# EasyEDA Pro project glowing_match_logo_easyEDA.eprj

# Schematic Schematic1
Board Name: Board1; Create Date: 2026-04-20; Page Name: P1; Project Name: match_Coin_V2; Schematic Name: Schematic1; Update Date: 2026-04-20; Company: EasyEDA.com; Page Size: A4; Version: V1.0
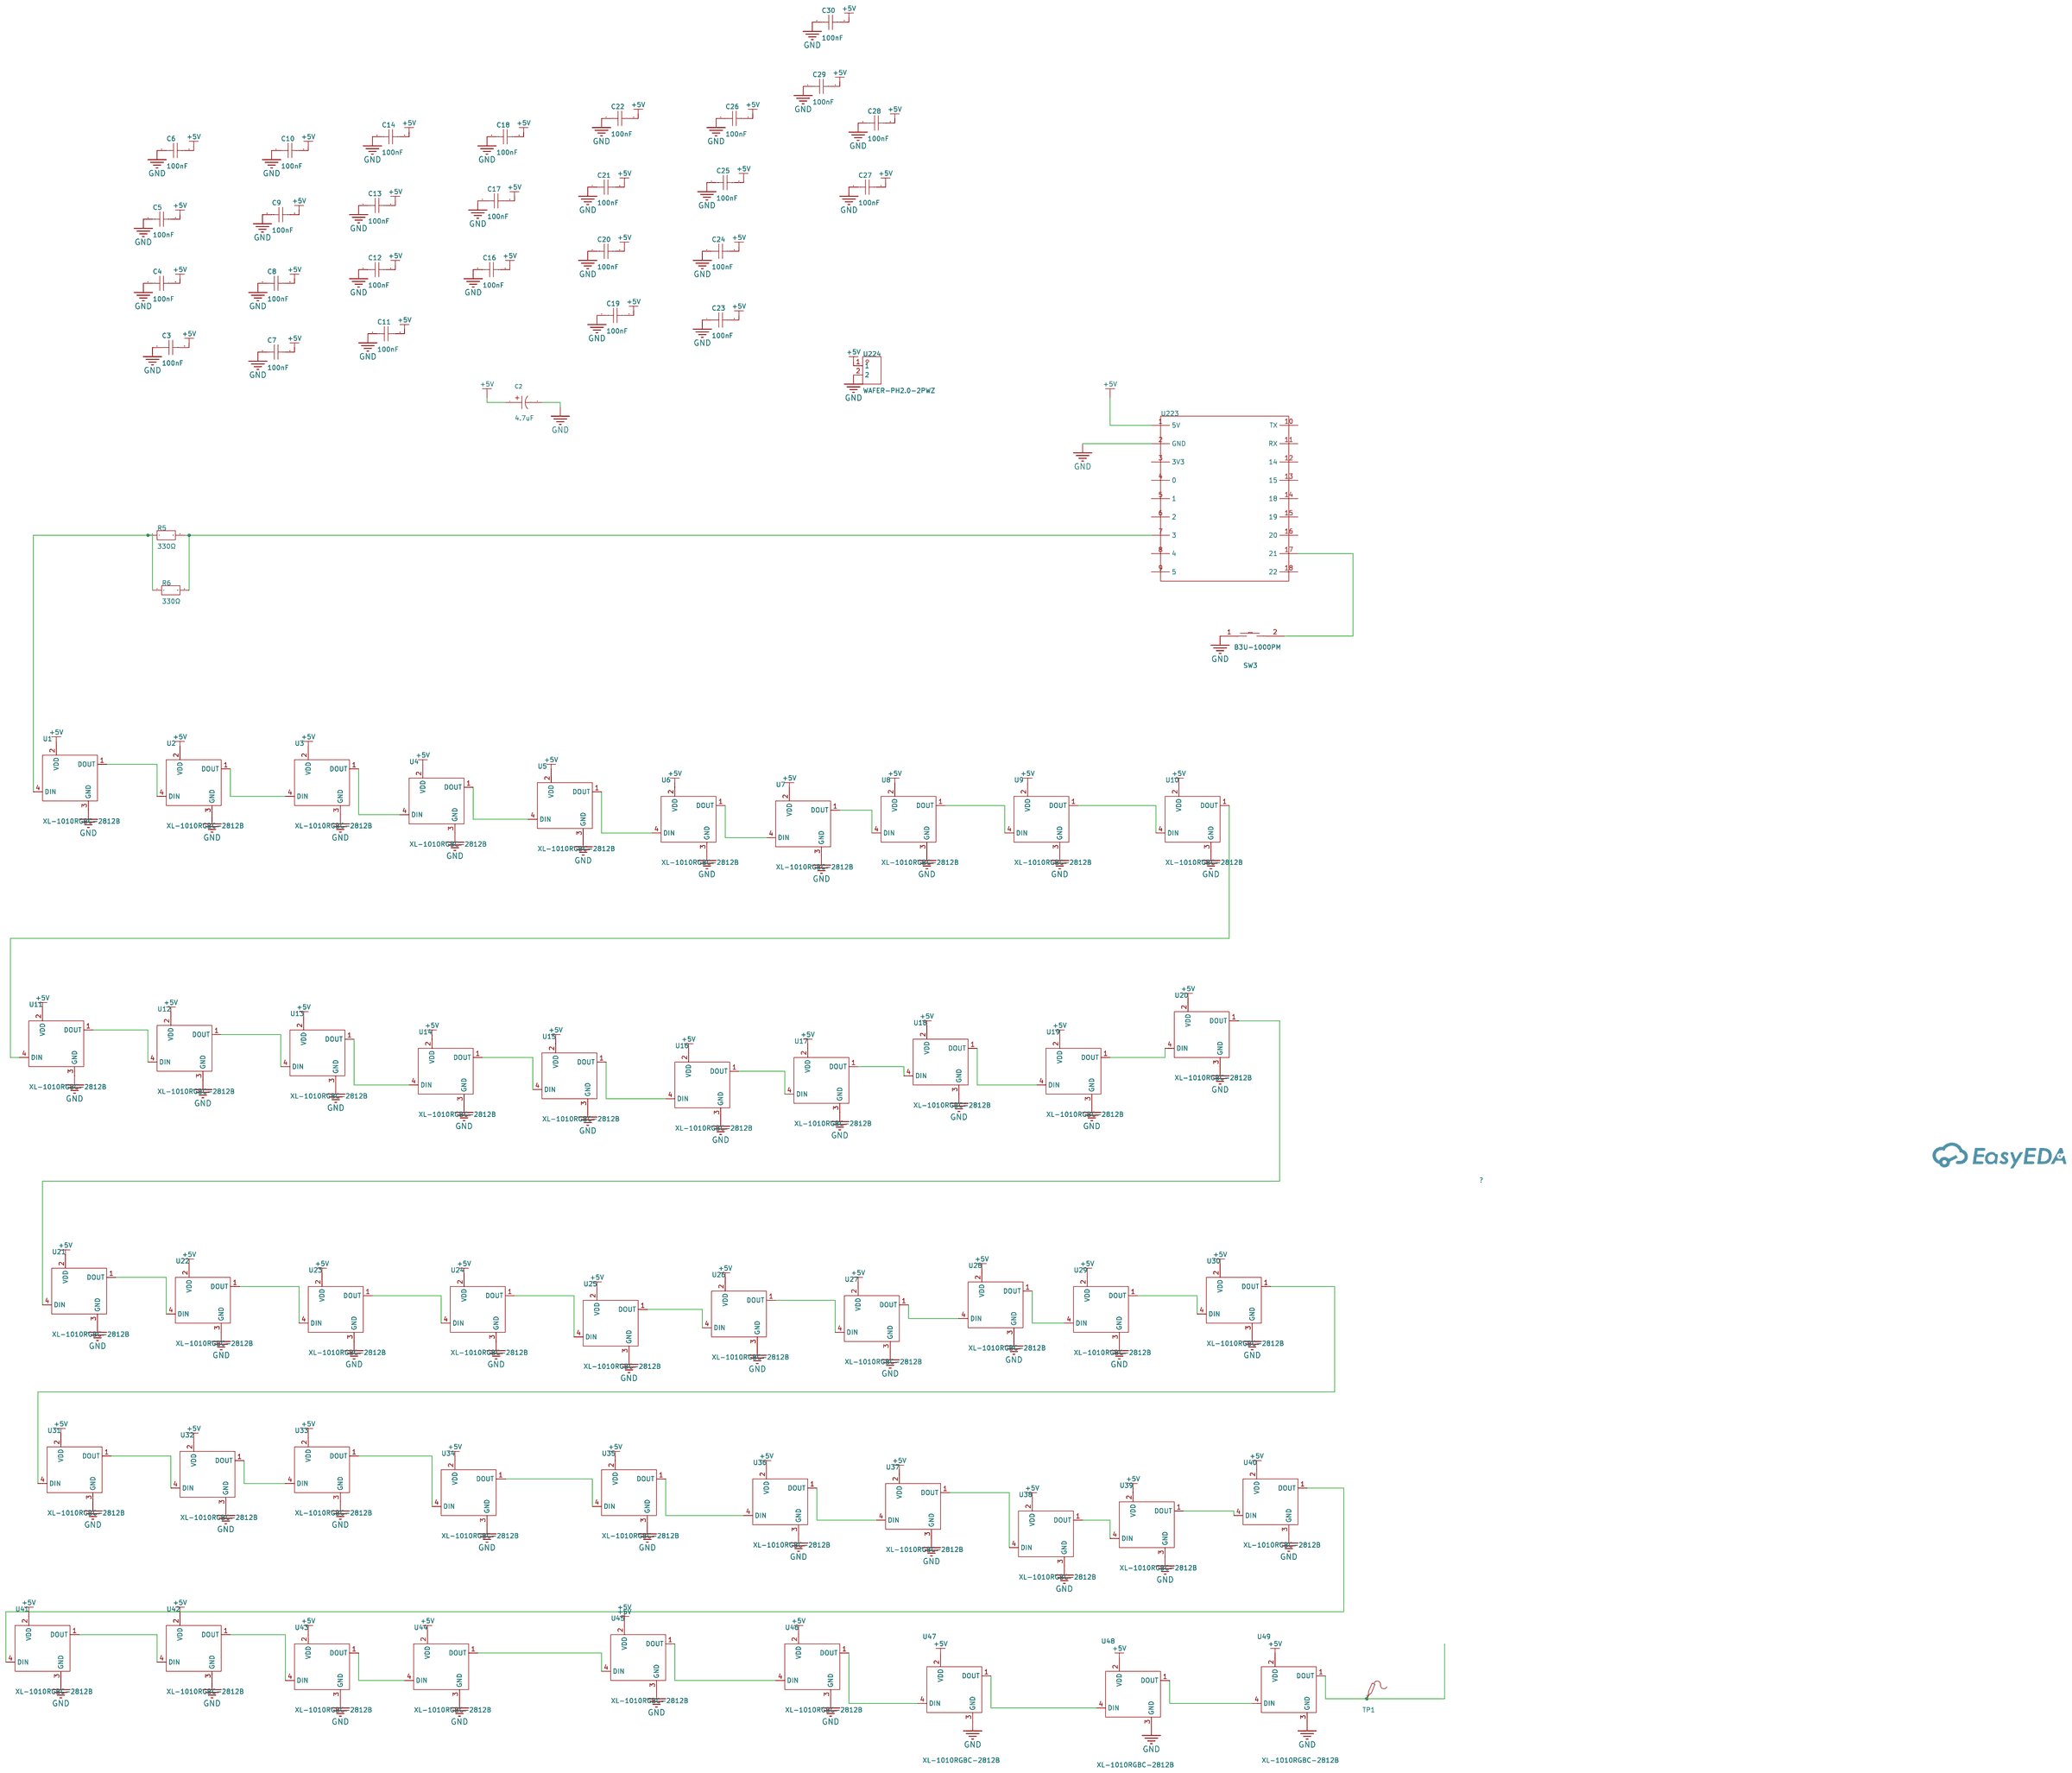
[diagram p0: schematic sheet]

## Parts
C2  4.7uF  [CAP-TH_BD6.3-P2.50-D0.5-FD]
C3  100nF  [C0402]
C4  100nF  [C0402]
C5  100nF  [C0402]
C6  100nF  [C0402]
C7  100nF  [C0402]
C8  100nF  [C0402]
C9  100nF  [C0402]
C10  100nF  [C0402]
C11  100nF  [C0402]
C12  100nF  [C0402]
C13  100nF  [C0402]
C14  100nF  [C0402]
C16  100nF  [C0402]
C17  100nF  [C0402]
C18  100nF  [C0402]
C19  100nF  [C0402]
C20  100nF  [C0402]
C21  100nF  [C0402]
C22  100nF  [C0402]
C23  100nF  [C0402]
C24  100nF  [C0402]
C25  100nF  [C0402]
C26  100nF  [C0402]
C27  100nF  [C0402]
C28  100nF  [C0402]
C29  100nF  [C0402]
C30  100nF  [C0402]
R5  330Ω  [RES-TH_BD2.4-L6.3-P10.30-D0.6]
R6  330Ω  [R0603]
SW3  B3U-1000PM  [KEY-SMD_B3U-1000PM]
TP1  -  [Test-Point-0.5mm]
U1  XL-1010RGBC-2812B  [LED-SMD_4P-L1.0-W1.0-TL_XL-1010RGBC-WS2812B]
U2  XL-1010RGBC-2812B  [LED-SMD_4P-L1.0-W1.0-TL_XL-1010RGBC-WS2812B]
U3  XL-1010RGBC-2812B  [LED-SMD_4P-L1.0-W1.0-TL_XL-1010RGBC-WS2812B]
U4  XL-1010RGBC-2812B  [LED-SMD_4P-L1.0-W1.0-TL_XL-1010RGBC-WS2812B]
U5  XL-1010RGBC-2812B  [LED-SMD_4P-L1.0-W1.0-TL_XL-1010RGBC-WS2812B]
U6  XL-1010RGBC-2812B  [LED-SMD_4P-L1.0-W1.0-TL_XL-1010RGBC-WS2812B]
U7  XL-1010RGBC-2812B  [LED-SMD_4P-L1.0-W1.0-TL_XL-1010RGBC-WS2812B]
U8  XL-1010RGBC-2812B  [LED-SMD_4P-L1.0-W1.0-TL_XL-1010RGBC-WS2812B]
U9  XL-1010RGBC-2812B  [LED-SMD_4P-L1.0-W1.0-TL_XL-1010RGBC-WS2812B]
U10  XL-1010RGBC-2812B  [LED-SMD_4P-L1.0-W1.0-TL_XL-1010RGBC-WS2812B]
U11  XL-1010RGBC-2812B  [LED-SMD_4P-L1.0-W1.0-TL_XL-1010RGBC-WS2812B]
U12  XL-1010RGBC-2812B  [LED-SMD_4P-L1.0-W1.0-TL_XL-1010RGBC-WS2812B]
U13  XL-1010RGBC-2812B  [LED-SMD_4P-L1.0-W1.0-TL_XL-1010RGBC-WS2812B]
U14  XL-1010RGBC-2812B  [LED-SMD_4P-L1.0-W1.0-TL_XL-1010RGBC-WS2812B]
U15  XL-1010RGBC-2812B  [LED-SMD_4P-L1.0-W1.0-TL_XL-1010RGBC-WS2812B]
U16  XL-1010RGBC-2812B  [LED-SMD_4P-L1.0-W1.0-TL_XL-1010RGBC-WS2812B]
U17  XL-1010RGBC-2812B  [LED-SMD_4P-L1.0-W1.0-TL_XL-1010RGBC-WS2812B]
U18  XL-1010RGBC-2812B  [LED-SMD_4P-L1.0-W1.0-TL_XL-1010RGBC-WS2812B]
U19  XL-1010RGBC-2812B  [LED-SMD_4P-L1.0-W1.0-TL_XL-1010RGBC-WS2812B]
U20  XL-1010RGBC-2812B  [LED-SMD_4P-L1.0-W1.0-TL_XL-1010RGBC-WS2812B]
U21  XL-1010RGBC-2812B  [LED-SMD_4P-L1.0-W1.0-TL_XL-1010RGBC-WS2812B]
U22  XL-1010RGBC-2812B  [LED-SMD_4P-L1.0-W1.0-TL_XL-1010RGBC-WS2812B]
U23  XL-1010RGBC-2812B  [LED-SMD_4P-L1.0-W1.0-TL_XL-1010RGBC-WS2812B]
U24  XL-1010RGBC-2812B  [LED-SMD_4P-L1.0-W1.0-TL_XL-1010RGBC-WS2812B]
U25  XL-1010RGBC-2812B  [LED-SMD_4P-L1.0-W1.0-TL_XL-1010RGBC-WS2812B]
U26  XL-1010RGBC-2812B  [LED-SMD_4P-L1.0-W1.0-TL_XL-1010RGBC-WS2812B]
U27  XL-1010RGBC-2812B  [LED-SMD_4P-L1.0-W1.0-TL_XL-1010RGBC-WS2812B]
U28  XL-1010RGBC-2812B  [LED-SMD_4P-L1.0-W1.0-TL_XL-1010RGBC-WS2812B]
U29  XL-1010RGBC-2812B  [LED-SMD_4P-L1.0-W1.0-TL_XL-1010RGBC-WS2812B]
U30  XL-1010RGBC-2812B  [LED-SMD_4P-L1.0-W1.0-TL_XL-1010RGBC-WS2812B]
U31  XL-1010RGBC-2812B  [LED-SMD_4P-L1.0-W1.0-TL_XL-1010RGBC-WS2812B]
U32  XL-1010RGBC-2812B  [LED-SMD_4P-L1.0-W1.0-TL_XL-1010RGBC-WS2812B]
U33  XL-1010RGBC-2812B  [LED-SMD_4P-L1.0-W1.0-TL_XL-1010RGBC-WS2812B]
U34  XL-1010RGBC-2812B  [LED-SMD_4P-L1.0-W1.0-TL_XL-1010RGBC-WS2812B]
U35  XL-1010RGBC-2812B  [LED-SMD_4P-L1.0-W1.0-TL_XL-1010RGBC-WS2812B]
U36  XL-1010RGBC-2812B  [LED-SMD_4P-L1.0-W1.0-TL_XL-1010RGBC-WS2812B]
U37  XL-1010RGBC-2812B  [LED-SMD_4P-L1.0-W1.0-TL_XL-1010RGBC-WS2812B]
U38  XL-1010RGBC-2812B  [LED-SMD_4P-L1.0-W1.0-TL_XL-1010RGBC-WS2812B]
U39  XL-1010RGBC-2812B  [LED-SMD_4P-L1.0-W1.0-TL_XL-1010RGBC-WS2812B]
U40  XL-1010RGBC-2812B  [LED-SMD_4P-L1.0-W1.0-TL_XL-1010RGBC-WS2812B]
U41  XL-1010RGBC-2812B  [LED-SMD_4P-L1.0-W1.0-TL_XL-1010RGBC-WS2812B]
U42  XL-1010RGBC-2812B  [LED-SMD_4P-L1.0-W1.0-TL_XL-1010RGBC-WS2812B]
U43  XL-1010RGBC-2812B  [LED-SMD_4P-L1.0-W1.0-TL_XL-1010RGBC-WS2812B]
U44  XL-1010RGBC-2812B  [LED-SMD_4P-L1.0-W1.0-TL_XL-1010RGBC-WS2812B]
U45  XL-1010RGBC-2812B  [LED-SMD_4P-L1.0-W1.0-TL_XL-1010RGBC-WS2812B]
U46  XL-1010RGBC-2812B  [LED-SMD_4P-L1.0-W1.0-TL_XL-1010RGBC-WS2812B]
U47  XL-1010RGBC-2812B  [LED-SMD_4P-L1.0-W1.0-TL_XL-1010RGBC-WS2812B]
U48  XL-1010RGBC-2812B  [LED-SMD_4P-L1.0-W1.0-TL_XL-1010RGBC-WS2812B]
U49  XL-1010RGBC-2812B  [LED-SMD_4P-L1.0-W1.0-TL_XL-1010RGBC-WS2812B]
U223  -  [ESP32-C6 Mini Dev Board]
U224  WAFER-PH2.0-2PWZ  [CONN-TH_2P-P2.00_GP01-2001WR-2P]

## Library data of the parts
C2 = HY2G4R7M060120CD288: Capacitance: Tolerance:±20% Tolerance:±20% Rated Voltage: Ripple Current:120mA@100kHz Equivalent Series Resistance(ESR):4.82Ω@100kHz Lead Spacing: φD:- L:- Lifetime @ Temp:5000hrs@105℃ Operating Temperature:-25℃~+105℃ Operating Temperature:-25℃~+105℃; LCSC Part Name: 4.7uF ±20% 400V; Supplier Part: C2841117; Manufacturer: HYNCDZ(宏远纳川); Supplier Footprint: 插件; JLCPCB Part Class: Extended Part; Datasheet: https://atta.szlcsc.com/upload/public/pdf/source/20210701/C2841117_C81FE0CD33662C934C89CBDD0DE883A3.pdf; Supplier: LCSC; Tolerance: ±20%; Ripple Current: 120mA@100kHz; Equivalent Series Resistance(ESR): 4.82Ω@100kHz; Lifetime @ Temp: 5000hrs@105℃; Operating Temperature: -25℃~+105℃
C3-C14 C16-C30 = CL05B104KO5NNNC: Capacitance:100nF Tolerance:±10% Tolerance:±10% Voltage Rating:16V Temperature Coefficient:X7R; LCSC Part Name: 100nF ±10% 16V; Supplier Part: C1525; Manufacturer: SAMSUNG(三星); Supplier Footprint: 0402; JLCPCB Part Class: Basic Part; Datasheet: https://item.szlcsc.com/datasheet/CL05B104KO5NNNC/1877.html; Supplier: LCSC; Tolerance: ±10%; Voltage Rating: 16V; Temperature Coefficient: X7R
R5 = MF0207FTE52-330R: Type:Metal Film Resistor Resistance:330Ω Tolerance:±1% Tolerance:±1% Power(Watts):600mW Temperature Coefficient:±50ppm/℃ Temperature Coefficient:±50ppm/℃ Operating Temperature:-55℃~+155℃ Operating Temperature:-55℃~+155℃; LCSC Part Name: 金属膜电阻 330Ω ±1% 600mW; Supplier Part: C1375137; Manufacturer: YAGEO(国巨); Supplier Footprint: 插件,D2.4xL6.3mm; JLCPCB Part Class: Extended Part; Datasheet: https://item.szlcsc.com/datasheet/MF0207FTE52-330R/1465426.html; Supplier: LCSC; Type: Metal Film Resistor; Tolerance: ±1%; Power(Watts): 600mW; Temperature Coefficient: ±50ppm/℃; Operating Temperature: -55℃~+155℃
R6 = FRC0603F3300TS: LCSC Part Name: 330Ω ±1% 100mW 厚膜电阻; Supplier Part: C2933198; Manufacturer: FOJAN(富捷); Supplier Footprint: 0603; JLCPCB Part Class: Extended Part; Datasheet: https://item.szlcsc.com/datasheet/FRC0603F3300TS/3279300.html; Supplier: LCSC; Type: Thick Film Resistor; Tolerance: ±1%; Power(Watts): 100mW; Voltage-Supply(Max): 75V; Temperature Coefficient: ±100ppm/℃; Operating Temperature: -55℃~+155℃
SW3 = B3U-1000PM: Circuit:SPST-NO Actuator Style:Round Button Operating Force:1.53N Mounting Type:Surface Mount,Vertical Contact Current:50mA Voltage Rating:12V IP Rating:IP40 Termination Style:SMD(SMT) Tab Operating Temperature:-25℃~+70℃ Operating Temperature:-25℃~+70℃; Supplier Part: C2934715; Manufacturer: OMRON(欧姆龙); JLCPCB Part Class: Extended Part; Datasheet: https://item.szlcsc.com/datasheet/B3U-1000PM/3283586.html; Supplier: LCSC; Circuit: SPST-NO; Actuator Style: Round Button; Operating Force: 1.53N; Mounting Type: Surface Mount,Vertical; Contact Current: 50mA; Voltage Rating: 12V; IP Rating: IP40; Termination Style: SMD(SMT) Tab; Operating Temperature: -25℃~+70℃
TP1 = Test-Point: Test Point 测试点
U1-U49 = XL-1010RGBC-2812B: Wavelength:620nm~625nm；465nm~475nm；520nm~530nm Luminous Intensity:300mcd；800mcd；200mcd Fixed-Frequency Pwm Mode:1kHz Data Transmission Rate:800Kbit/s Voltage - Supply:4.5V~5.5V Voltage - Supply:4.5V~5.5V Quiescent Current:0.35mA Lens Color:Water Clear ESD; LCSC Part Name: XL-1010RGBC-WS2812B; Supplier Part: C5349953; Manufacturer: XINGLIGHT(成兴光); Supplier Footprint: SMD,1x1mm; JLCPCB Part Class: Extended Part; Datasheet: https://item.szlcsc.com/datasheet/XL-1010RGBC-2812B/6136402.html; Supplier: LCSC; Wavelength: 620nm~625nm；465nm~475nm；520nm~530nm; Luminous Intensity: 300mcd；800mcd；200mcd; Fixed-Frequency Pwm Mode: 1kHz; Data Transmission Rate: 800Kbit/s; Voltage - Supply: 4.5V~5.5V; Quiescent Current: 0.35mA; Lens Color: Water Clear; ESD Withstand Voltage: 2000V; Installation method: Top-mount; Operating Temperature: -20℃~+85℃; Peak Wavelength: R:625nm；B:470nm；G:525nm; Viewing Angle: 120°; Length: 1mm; Width: 0.8mm; Height: 1mm
U223 = ESP32 C3 Super mini.STEP
U224 = WAFER-PH2.0-2PWZ: Pins Structure:1x2P Pitch:2mm Mounting Type:Right Angle Reference Series:PH Number of Pins:2P Number of Rows:1 Number of PINs Per Row:2 Row Spacing:- Current Rating:2A Contact Material:Brass Contact Plating:Tin Operating Temperature:-25℃~+85℃ Operating Te; LCSC Part Name: 1x2P 间距:2mm 弯插 系列:PH; Supplier Part: C5359610; Manufacturer: XUNPU(讯普); Supplier Footprint: 弯插,P=2mm; JLCPCB Part Class: Extended Part; Datasheet: https://item.szlcsc.com/datasheet/WAFER-PH2.0-2PWZ/6173846.html; Supplier: LCSC; Pins Structure: 1x2P; Pitch: 2mm; Mounting Type: Right Angle; Reference Series: PH; Number of Pins: 2P; Number of Rows: 1; Number of PINs Per Row: 2; Current Rating: 2A; Contact Material: Brass; Contact Plating: Tin; Operating Temperature: -25℃~+85℃; Voltage Rating: 250V; Plastic Material: PA66; Flame Retardant Rating: UL94V-0; Color: White; Z-Height of the Board: 4.7mm; X-Length of Bottom Edge on Board (Spacing Line): 6mm; Y-Width of Bottom Edge on Board: 6.05mm

## Nets
+5V: C2.1 C3.2 C4.2 C5.2 C6.2 C7.2 C8.2 C9.2 C10.2 C11.2 C12.2 C13.2 C14.2 C16.2 C17.2 C18.2 C19.2 C20.2 C21.2 C22.2 C23.2 C24.2 C25.2 C26.2 C27.2 C28.2 C29.2 C30.2 U1.2(VDD) U2.2(VDD) U3.2(VDD) U4.2(VDD) U5.2(VDD) U6.2(VDD) U7.2(VDD) U8.2(VDD) U9.2(VDD) U10.2(VDD) U11.2(VDD) U12.2(VDD) U13.2(VDD) U14.2(VDD) U15.2(VDD) U16.2(VDD) U17.2(VDD) U18.2(VDD) U19.2(VDD) U20.2(VDD) U21.2(VDD) U22.2(VDD) U23.2(VDD) U24.2(VDD) U25.2(VDD) U26.2(VDD) U27.2(VDD) U28.2(VDD) U29.2(VDD) U30.2(VDD) U31.2(VDD) U32.2(VDD) U33.2(VDD) U34.2(VDD) U35.2(VDD) U36.2(VDD) U37.2(VDD) U38.2(VDD) U39.2(VDD) U40.2(VDD) U41.2(VDD) U42.2(VDD) U43.2(VDD) U44.2(VDD) U45.2(VDD) U46.2(VDD) U47.2(VDD) U48.2(VDD) U49.2(VDD) U223.1(5V) U224.1
GND: C2.2 C3.1 C4.1 C5.1 C6.1 C7.1 C8.1 C9.1 C10.1 C11.1 C12.1 C13.1 C14.1 C16.1 C17.1 C18.1 C19.1 C20.1 C21.1 C22.1 C23.1 C24.1 C25.1 C26.1 C27.1 C28.1 C29.1 C30.1 SW3.1 U1.3(GND) U2.3(GND) U3.3(GND) U4.3(GND) U5.3(GND) U6.3(GND) U7.3(GND) U8.3(GND) U9.3(GND) U10.3(GND) U11.3(GND) U12.3(GND) U13.3(GND) U14.3(GND) U15.3(GND) U16.3(GND) U17.3(GND) U18.3(GND) U19.3(GND) U20.3(GND) U21.3(GND) U22.3(GND) U23.3(GND) U24.3(GND) U25.3(GND) U26.3(GND) U27.3(GND) U28.3(GND) U29.3(GND) U30.3(GND) U31.3(GND) U32.3(GND) U33.3(GND) U34.3(GND) U35.3(GND) U36.3(GND) U37.3(GND) U38.3(GND) U39.3(GND) U40.3(GND) U41.3(GND) U42.3(GND) U43.3(GND) U44.3(GND) U45.3(GND) U46.3(GND) U47.3(GND) U48.3(GND) U49.3(GND) U223.2(GND) U224.2
$1N22245: U1.1(DOUT) U2.4(DIN)
$1N22251: U2.1(DOUT) U3.4(DIN)
$1N22257: U3.1(DOUT) U4.4(DIN)
$1N22263: U4.1(DOUT) U5.4(DIN)
$1N22466: R5.2 R6.2 U223.7(3)
$1N22470: R5.1 R6.1 U1.4(DIN)
$1N22510: SW3.2 U223.17(21)
$1N24931: U5.1(DOUT) U6.4(DIN)
$1N24936: U6.1(DOUT) U7.4(DIN)
$1N24942: U7.1(DOUT) U8.4(DIN)
$1N24948: U8.1(DOUT) U9.4(DIN)
$1N24954: U9.1(DOUT) U10.4(DIN)
$1N24960: U10.1(DOUT) U11.4(DIN)
$1N24968: U11.1(DOUT) U12.4(DIN)
$1N24974: U12.1(DOUT) U13.4(DIN)
$1N24980: U13.1(DOUT) U14.4(DIN)
$1N24986: U14.1(DOUT) U15.4(DIN)
$1N24992: U15.1(DOUT) U16.4(DIN)
$1N24998: U16.1(DOUT) U17.4(DIN)
$1N25004: U17.1(DOUT) U18.4(DIN)
$1N25010: U18.1(DOUT) U19.4(DIN)
$1N25016: U19.1(DOUT) U20.4(DIN)
$1N25022: U20.1(DOUT) U21.4(DIN)
$1N25030: U21.1(DOUT) U22.4(DIN)
$1N25036: U22.1(DOUT) U23.4(DIN)
$1N25042: U23.1(DOUT) U24.4(DIN)
$1N25048: U24.1(DOUT) U25.4(DIN)
$1N25054: U25.1(DOUT) U26.4(DIN)
$1N25060: U26.1(DOUT) U27.4(DIN)
$1N25066: U27.1(DOUT) U28.4(DIN)
$1N25072: U28.1(DOUT) U29.4(DIN)
$1N25078: U29.1(DOUT) U30.4(DIN)
$1N25084: U30.1(DOUT) U31.4(DIN)
$1N25095: U31.1(DOUT) U32.4(DIN)
$1N25101: U32.1(DOUT) U33.4(DIN)
$1N25107: U33.1(DOUT) U34.4(DIN)
$1N25113: U34.1(DOUT) U35.4(DIN)
$1N25119: U35.1(DOUT) U36.4(DIN)
$1N25125: U36.1(DOUT) U37.4(DIN)
$1N25131: U37.1(DOUT) U38.4(DIN)
$1N25137: U38.1(DOUT) U39.4(DIN)
$1N25143: U39.1(DOUT) U40.4(DIN)
$1N25149: U40.1(DOUT) U41.4(DIN)
$1N25157: U41.1(DOUT) U42.4(DIN)
$1N25163: U42.1(DOUT) U43.4(DIN)
$1N25185: U43.1(DOUT) U44.4(DIN)
$1N25190: U44.1(DOUT) U45.4(DIN)
$1N25196: U45.1(DOUT) U46.4(DIN)
$1N25202: U46.1(DOUT) U47.4(DIN)
$1N27838: U47.1(DOUT) U48.4(DIN)
$1N27919: U48.1(DOUT) U49.4(DIN)
$1N27977: TP1.1 U49.1(DOUT)

Not connected (* = marked no-connect by the designer): U223 3(3V3) 4(0) 5(1) 6(2) 8(4) 9(5) 10(TX) 11(RX) 12(14) 13(15) 14(18) 15(19) 16(20) 18(22)

# Board PCB1
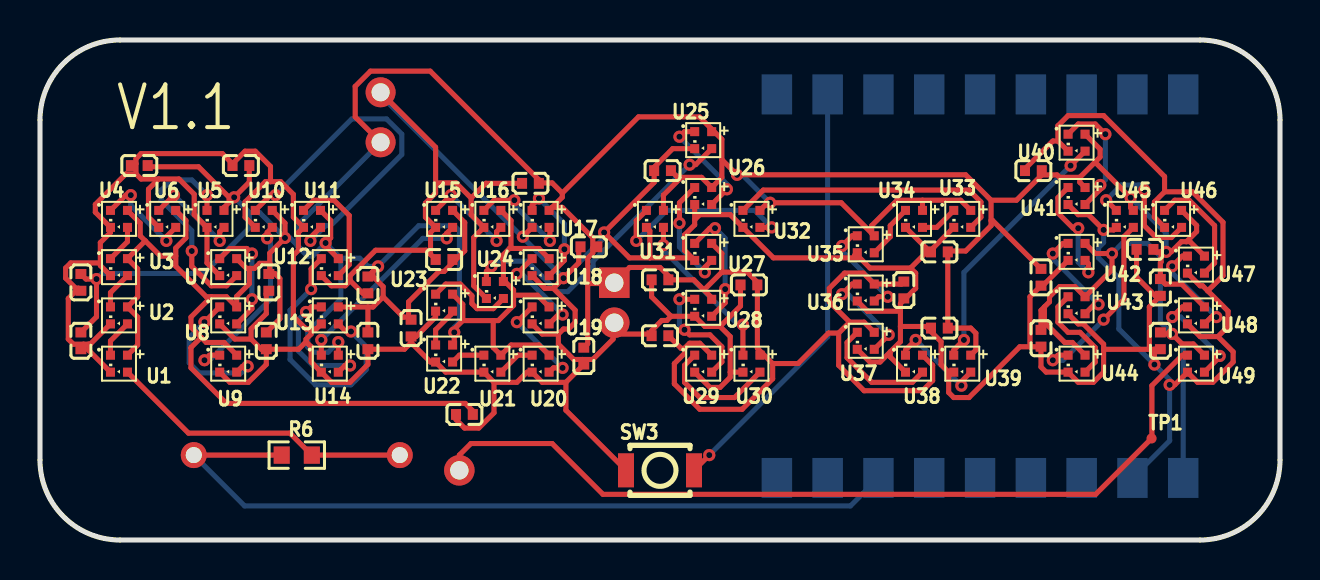
[diagram p1: board, top side]
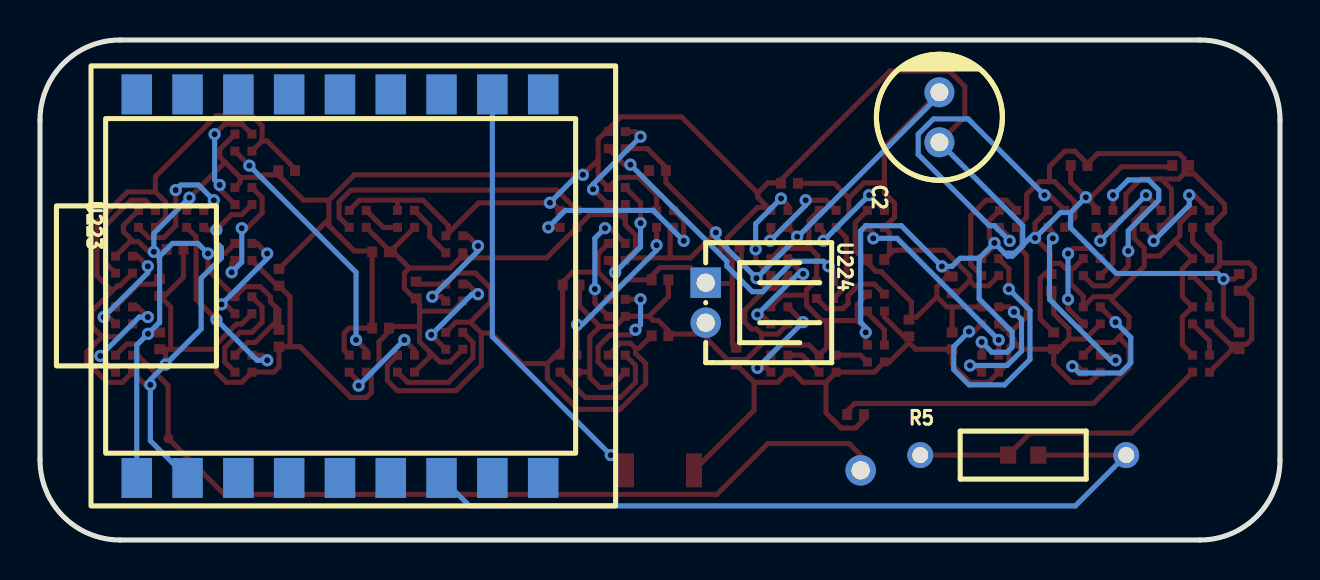
[diagram p2: board, bottom side, seen from below]

Outline 62 x 25 mm; copper layers: Top Layer, Bottom Layer. Coordinates in mm from the lower left corner of the outline.
Outline path: 0,21 0,4 arc(1.17,1.17) 4,0 58,0 arc(60.83,1.17) 62,4 62,21 arc(60.83,23.83) 58,25 4,25 arc(1.17,23.83) 0,21
Stack: Top Layer 0.035mm / Dielectric1 1.51mm FR4 er 4.5 / Bottom Layer 0.035mm

## Design rules (mm)
template: JLCPCB Capability(Two Layers Board)
spacing copperThickness1oz (default): track to track 0.102, other pairs 0.152 to 0.3
spacing copperThickness2oz: track to track 0.203, other pairs 0.152 to 0.3
track width copperThickness1oz (default): min 0.127, default 0.254, max 2.54
track width copperThickness2oz: min 0.203, default 0.254, max 2.54
differential pair differentialPair (default): width min 0.127, default 0.254, max 2.54; gap min 0.152, default 0.152
via viaSize (default): diameter min 0.5, default 0.61, max 10; hole min 0.3, default 0.305, max 6.3

## Placement (name value [footprint] x y rotation side)
C2  4.7uF  [CAP-TH_BD6.3-P2.50-D0.5-FD]  17.03 21.14 90 bottom
C3  100nF  [C0402]  2.04 9.96 90 top
C4  100nF  [C0402]  50.05 13.14 90 top
C5  100nF  [C0402]  44.97 10.59 0 top
C6  100nF  [C0402]  24.52 17.83 0 top
C7  100nF  [C0402]  43.19 12.5 90 top
C8  100nF  [C0402]  35.44 12.75 0 top
C9  100nF  [C0402]  27.19 9.2 90 top
C10  100nF  [C0402]  20.21 14.02 0 top
C11  100nF  [C0402]  31 13.01 0 top
C12  100nF  [C0402]  27.44 14.66 0 top
C13  100nF  [C0402]  18.55 10.59 90 top
C14  100nF  [C0402]  31.13 18.47 0 top
C16  100nF  [C0402]  21.22 6.28 0 top
C17  100nF  [C0402]  56.02 9.96 90 top
C18  100nF  [C0402]  11.31 9.96 90 top
C19  100nF  [C0402]  16.4 9.96 90 top
C20  100nF  [C0402]  31 10.21 0 top
C21  100nF  [C0402]  44.97 14.41 0 top
C22  100nF  [C0402]  10.04 18.72 0 top
C23  100nF  [C0402]  11.44 12.88 90 top
C24  100nF  [C0402]  16.4 12.75 90 top
C25  100nF  [C0402]  2.04 12.88 90 top
C26  100nF  [C0402]  4.97 18.72 0 top
C27  100nF  [C0402]  49.67 18.47 0 top
C28  100nF  [C0402]  56.02 12.63 90 top
C29  100nF  [C0402]  50.05 10.09 90 top
C30  100nF  [C0402]  55.25 14.53 0 top
NOREF  -  [Pad_e1]  20.97 3.48 0 top
R5  330Ω  [RES-TH_BD2.4-L6.3-P10.30-D0.6]  12.84 4.25 180 bottom
R6  330Ω  [R0603]  12.84 4.25 180 top
SW3  B3U-1000PM  [KEY-SMD_B3U-1000PM]  31 3.48 0 top
TP1  -  [Test-Point-0.5mm]  55.58 5.08 0 top
U1  XL-1010RGBC-2812B  [LED-SMD_4P-L1.0-W1.0-TL_XL-1010RGBC-WS2812B]  3.95 8.82 0 top
U2  XL-1010RGBC-2812B  [LED-SMD_4P-L1.0-W1.0-TL_XL-1010RGBC-WS2812B]  3.95 11.23 0 top
U3  XL-1010RGBC-2812B  [LED-SMD_4P-L1.0-W1.0-TL_XL-1010RGBC-WS2812B]  3.95 13.64 0 top
U4  XL-1010RGBC-2812B  [LED-SMD_4P-L1.0-W1.0-TL_XL-1010RGBC-WS2812B]  3.95 16.06 0 top
U5  XL-1010RGBC-2812B  [LED-SMD_4P-L1.0-W1.0-TL_XL-1010RGBC-WS2812B]  6.36 16.06 0 top
U6  XL-1010RGBC-2812B  [LED-SMD_4P-L1.0-W1.0-TL_XL-1010RGBC-WS2812B]  8.78 16.06 0 top
U7  XL-1010RGBC-2812B  [LED-SMD_4P-L1.0-W1.0-TL_XL-1010RGBC-WS2812B]  9.41 13.64 0 top
U8  XL-1010RGBC-2812B  [LED-SMD_4P-L1.0-W1.0-TL_XL-1010RGBC-WS2812B]  9.41 11.23 0 top
U9  XL-1010RGBC-2812B  [LED-SMD_4P-L1.0-W1.0-TL_XL-1010RGBC-WS2812B]  9.41 8.82 0 top
U10  XL-1010RGBC-2812B  [LED-SMD_4P-L1.0-W1.0-TL_XL-1010RGBC-WS2812B]  11.19 16.06 0 top
U11  XL-1010RGBC-2812B  [LED-SMD_4P-L1.0-W1.0-TL_XL-1010RGBC-WS2812B]  13.6 16.06 0 top
U12  XL-1010RGBC-2812B  [LED-SMD_4P-L1.0-W1.0-TL_XL-1010RGBC-WS2812B]  14.49 13.64 0 top
U13  XL-1010RGBC-2812B  [LED-SMD_4P-L1.0-W1.0-TL_XL-1010RGBC-WS2812B]  14.49 11.23 0 top
U14  XL-1010RGBC-2812B  [LED-SMD_4P-L1.0-W1.0-TL_XL-1010RGBC-WS2812B]  14.49 8.82 0 top
U15  XL-1010RGBC-2812B  [LED-SMD_4P-L1.0-W1.0-TL_XL-1010RGBC-WS2812B]  20.21 16.06 0 top
U16  XL-1010RGBC-2812B  [LED-SMD_4P-L1.0-W1.0-TL_XL-1010RGBC-WS2812B]  22.62 16.06 0 top
U17  XL-1010RGBC-2812B  [LED-SMD_4P-L1.0-W1.0-TL_XL-1010RGBC-WS2812B]  25.03 16.06 0 top
U18  XL-1010RGBC-2812B  [LED-SMD_4P-L1.0-W1.0-TL_XL-1010RGBC-WS2812B]  25.03 13.64 0 top
U19  XL-1010RGBC-2812B  [LED-SMD_4P-L1.0-W1.0-TL_XL-1010RGBC-WS2812B]  25.03 11.23 0 top
U20  XL-1010RGBC-2812B  [LED-SMD_4P-L1.0-W1.0-TL_XL-1010RGBC-WS2812B]  25.03 8.82 0 top
U21  XL-1010RGBC-2812B  [LED-SMD_4P-L1.0-W1.0-TL_XL-1010RGBC-WS2812B]  22.62 8.82 0 top
U22  XL-1010RGBC-2812B  [LED-SMD_4P-L1.0-W1.0-TL_XL-1010RGBC-WS2812B]  20.21 9.33 0 top
U23  XL-1010RGBC-2812B  [LED-SMD_4P-L1.0-W1.0-TL_XL-1010RGBC-WS2812B]  20.21 11.86 0 top
U24  XL-1010RGBC-2812B  [LED-SMD_4P-L1.0-W1.0-TL_XL-1010RGBC-WS2812B]  22.75 12.5 0 top
U25  XL-1010RGBC-2812B  [LED-SMD_4P-L1.0-W1.0-TL_XL-1010RGBC-WS2812B]  33.16 19.99 0 top
U26  XL-1010RGBC-2812B  [LED-SMD_4P-L1.0-W1.0-TL_XL-1010RGBC-WS2812B]  33.16 17.2 0 top
U27  XL-1010RGBC-2812B  [LED-SMD_4P-L1.0-W1.0-TL_XL-1010RGBC-WS2812B]  33.16 14.41 0 top
U28  XL-1010RGBC-2812B  [LED-SMD_4P-L1.0-W1.0-TL_XL-1010RGBC-WS2812B]  33.16 11.61 0 top
U29  XL-1010RGBC-2812B  [LED-SMD_4P-L1.0-W1.0-TL_XL-1010RGBC-WS2812B]  33.16 8.82 0 top
U30  XL-1010RGBC-2812B  [LED-SMD_4P-L1.0-W1.0-TL_XL-1010RGBC-WS2812B]  35.57 8.82 0 top
U31  XL-1010RGBC-2812B  [LED-SMD_4P-L1.0-W1.0-TL_XL-1010RGBC-WS2812B]  30.75 16.06 0 top
U32  XL-1010RGBC-2812B  [LED-SMD_4P-L1.0-W1.0-TL_XL-1010RGBC-WS2812B]  35.57 16.06 0 top
U33  XL-1010RGBC-2812B  [LED-SMD_4P-L1.0-W1.0-TL_XL-1010RGBC-WS2812B]  46.11 16.06 0 top
U34  XL-1010RGBC-2812B  [LED-SMD_4P-L1.0-W1.0-TL_XL-1010RGBC-WS2812B]  43.7 16.06 0 top
U35  XL-1010RGBC-2812B  [LED-SMD_4P-L1.0-W1.0-TL_XL-1010RGBC-WS2812B]  41.29 14.79 0 top
U36  XL-1010RGBC-2812B  [LED-SMD_4P-L1.0-W1.0-TL_XL-1010RGBC-WS2812B]  41.29 12.37 0 top
U37  XL-1010RGBC-2812B  [LED-SMD_4P-L1.0-W1.0-TL_XL-1010RGBC-WS2812B]  41.29 9.96 0 top
U38  XL-1010RGBC-2812B  [LED-SMD_4P-L1.0-W1.0-TL_XL-1010RGBC-WS2812B]  43.7 8.82 0 top
U39  XL-1010RGBC-2812B  [LED-SMD_4P-L1.0-W1.0-TL_XL-1010RGBC-WS2812B]  46.11 8.82 0 top
U40  XL-1010RGBC-2812B  [LED-SMD_4P-L1.0-W1.0-TL_XL-1010RGBC-WS2812B]  51.83 19.87 0 top
U41  XL-1010RGBC-2812B  [LED-SMD_4P-L1.0-W1.0-TL_XL-1010RGBC-WS2812B]  51.83 17.2 0 top
U42  XL-1010RGBC-2812B  [LED-SMD_4P-L1.0-W1.0-TL_XL-1010RGBC-WS2812B]  51.83 14.41 0 top
U43  XL-1010RGBC-2812B  [LED-SMD_4P-L1.0-W1.0-TL_XL-1010RGBC-WS2812B]  51.83 11.74 0 top
U44  XL-1010RGBC-2812B  [LED-SMD_4P-L1.0-W1.0-TL_XL-1010RGBC-WS2812B]  51.83 8.82 0 top
U45  XL-1010RGBC-2812B  [LED-SMD_4P-L1.0-W1.0-TL_XL-1010RGBC-WS2812B]  54.24 16.06 0 top
U46  XL-1010RGBC-2812B  [LED-SMD_4P-L1.0-W1.0-TL_XL-1010RGBC-WS2812B]  56.65 16.06 0 top
U47  XL-1010RGBC-2812B  [LED-SMD_4P-L1.0-W1.0-TL_XL-1010RGBC-WS2812B]  57.8 13.77 0 top
U48  XL-1010RGBC-2812B  [LED-SMD_4P-L1.0-W1.0-TL_XL-1010RGBC-WS2812B]  57.8 11.23 0 top
U49  XL-1010RGBC-2812B  [LED-SMD_4P-L1.0-W1.0-TL_XL-1010RGBC-WS2812B]  57.8 8.82 0 top
U223  -  [ESP32-C6 Mini Dev Board]  60.72 1.7 90 bottom
U224  WAFER-PH2.0-2PWZ  [CONN-TH_2P-P2.00_GP01-2001WR-2P]  28.71 11.86 270 bottom

## Footprints (pads in the part's own frame, mm; a bottom-side part is the same pattern mirrored in y, then rotated)
C0402
  rect 0.5x0.54 smd: 1(-0.42,0) 2(0.42,0)
CAP-TH_BD6.3-P2.50-D0.5-FD
  round 1.5 hole 0.9: 1(-1.25,0) 2(1.25,0)
CONN-TH_2P-P2.00_GP01-2001WR-2P
  rect 1.524x1.524 hole 0.914: 1(-1,0)
  round 1.524 hole 0.914: 2(1,0)
ESP32-C6 Mini Dev Board
  rect 2x1.524 smd: 1(1.397,-3.556) 2(1.397,-6.096) 3(1.397,-8.636) 4(1.397,-11.176) 5(1.397,-13.716) 6(1.397,-16.256) 7(1.397,-18.796) 8(1.397,-21.336) 9(1.397,-23.876) 10(20.574,-3.556) 11(20.574,-6.096) 12(20.574,-8.636) 13(20.574,-11.176) 14(20.574,-13.716) 15(20.574,-16.256) 16(20.574,-18.796) 17(20.574,-21.336) 18(20.574,-23.876)
KEY-SMD_B3U-1000PM
  rect 0.8x1.7 smd: 1(-1.7,0) 2(1.7,0)
LED-SMD_4P-L1.0-W1.0-TL_XL-1010RGBC-WS2812B
  rect 0.45x0.45 smd: 1(-0.425,0.424) 2(0.425,0.425) 3(-0.425,-0.425) 4(0.425,-0.425)
Pad_e1
  round 1.524 hole 0.914: 1(0,0)
R0603
  rect 0.806x0.864 smd: 1(-0.753,0) 2(0.753,0)
RES-TH_BD2.4-L6.3-P10.30-D0.6
  round 1.3 hole 0.8: 1(-5.15,0) 2(5.15,0)
Test-Point-0.5mm
  round 0.5 smd: 1(0,0)

## Nets
As in the schematic, except:
$1N27977: NOREF.1 TP1.1 U49.1

Pads without a net: U223 3 4 5 6 8 9 10 11 12 13 14 15 16 18

## Via types
v1: diameter 0.61, hole 0.305, Top Layer to Bottom Layer, 86 vias

## Routing (per net, layer and track width the routed paths; a pad name or vN(x,y) marks a point on that pad's centre or on a via; arc(x,y) is an arc through that point)
+5V: length 336
  Top Layer w0.254: 8.06,10.13 7.55,9.62 7.55,8.61 9.33,6.83 21.26,6.83 21.64,6.45 C16.2 ; 8.06,10.13 7.55,10.64 7.55,11.15 8.56,12.16 ; 8.06,10.13 8.31,9.88 9.2,9.88 U9.2 ; 33.2,12.5 34.09,13.39 ; 33.2,12.5 33.58,12.11 U28.2 ; 33.2,12.5 32.69,13.01 C11.2 31.42,13.21 31,13.63 29.48,13.63 U224.1 28.67,12.82 27.38,12.82 ; 34.09,13.39 34.09,14.32 U27.2 ; 34.09,13.39 35.36,13.39 35.87,12.89 ; 47.55,16.99 46.28,18.26 v1(34.85,18.26) 34.09,19.02 ; 47.55,16.99 47.55,15.97 ; 47.55,16.99 48.82,16.99 50.09,18.25 ; 33.58,20.55 32.97,21.16 29.93,21.16 26.12,17.35 ; 33.58,20.55 U25.2 ; 33.58,20.55 34.09,20.04 34.09,19.02 ; U37.2 41.2,10.89 40.48,10.89 ; 9.45,16.88 v1(9.71,17.14) 10.47,17.89 C22.2 ; 9.45,16.88 9.2,16.63 U6.2 ; 9.45,16.88 9.45,17.14 7.93,18.66 5.45,18.66 C26.2 ; 39.93,10.35 40.48,10.89 ; 39.93,10.35 39.43,10.35 37.9,8.82 36.63,8.82 ; 39.93,10.35 39.93,8.73 41.2,7.46 44.12,7.46 44.63,7.97 44.63,8.73 U38.2 ; 40.48,10.89 39.47,11.91 39.47,12.58 40.23,13.34 41.16,13.34 U36.2 43.07,12.8 C7.2 ; 35.87,12.89 35.87,9.58 36.12,9.33 ; 35.87,12.89 C8.2 ; 27.64,14.6 C12.2 ; 27.64,14.6 27.64,15.11 26.12,16.63 25.61,16.63 ; 27.64,14.6 27.64,14.35 27.38,14.09 27.38,12.82 ; 23.17,13 23.68,12.5 23.68,12.24 ; 23.17,13 23.17,14.02 23.11,14.08 23.11,14.21 23.47,14.58 ; 23.17,13 U24.2 ; 5.26,14.96 U3.2 4.88,13.56 4.88,12.16 U2.2 4.88,11.15 4.88,9.75 U1.2 ; 5.26,14.96 5.01,15.21 5.01,15.85 U4.2 ; 5.26,14.96 6.03,14.19 6.79,14.19 ; 11.49,13.33 C23.2 ; 11.49,13.33 11.49,13.83 ; 11.49,13.33 11.74,13.33 11.99,13.07 11.99,11.06 C18.2 ; C25.2 2.3,13.05 v1(2.83,13.05) 2.83,11.16 C3.2 ; 10.47,13.58 10.72,13.58 10.98,13.83 11.49,13.83 ; 10.47,13.58 10.47,12.82 9.84,12.18 U8.2 9.33,12.16 8.56,12.16 ; 10.47,13.58 10.32,13.58 U7.2 ; 36.12,9.33 U30.2 ; 36.12,9.33 36.63,8.82 ; U49.2 57.66,9.8 57.11,9.8 v1(56.6,10.31) 56.09,10.31 C17.2 ; 34.09,19.02 34.09,18.13 U26.2 33.08,18.13 32.06,18.13 ; U23.2 21.14,11.78 21.14,10.97 ; C20.2 32.05,9.58 32.23,9.58 ; 57.32,14.92 57.5,14.92 U47.2 ; 57.32,14.92 57.83,15.42 57.83,15.73 U46.2 ; 57.32,14.92 57.07,14.92 56.56,14.41 v1(56.31,14.41) 56.05,14.41 ; 44.12,16.99 U34.2 ; 44.12,16.99 42.85,16.99 41.59,15.72 41.59,15.34 ; 44.12,16.99 46.03,16.99 U33.2 ; 25.61,16.63 U17.2 ; 25.61,16.63 26.12,17.14 26.12,17.35 ; 50.22,11.66 50.05,11.48 C29.2 ; 50.22,11.66 50.47,11.91 50.47,12.16 50.98,12.67 51.75,12.67 U43.2 53.6,13.51 v1(53.6,14.32) 52.76,14.32 U42.2 ; 50.22,11.66 50.22,10.89 51.24,9.88 51.62,9.88 U44.2 ; 8.56,12.16 8.31,12.16 6.79,13.69 6.79,14.19 ; 16.65,13.43 C24.2 ; 16.65,13.43 v1(16.9,13.68) ; 16.65,13.43 16.65,13.17 17.16,12.67 17.16,12.16 ; U41.2 51.99,17.89 51.99,18.13 ; 23.47,14.58 23.55,14.65 23.55,15.97 U16.2 ; 23.47,14.58 24.95,14.58 U18.2 ; C9.2 27.38,9.81 27.38,12.82 ; U20.2 24.95,9.75 23.55,9.75 U21.2 22.66,9.62 22.66,10.97 ; 6.79,14.19 6.79,14.6 7.3,15.1 7.3,15.97 6.79,16.48 ; 32.06,18.13 31.88,18.13 C14.2 ; 32.06,18.13 31.17,17.24 U31.2 ; 50.09,18.25 50.85,18.25 50.97,18.13 51.99,18.13 ; 50.09,18.25 C27.2 ; 52.75,18.89 v1(54.53,17.12) 54.53,16.62 U45.2 ; 52.75,18.89 51.99,18.13 ; 52.75,18.89 53.01,19.15 53.01,19.54 U40.2 ; 56.05,14.41 56.05,13.9 56.02,13.87 C28.2 56.27,12.79 57.08,12.79 U48.2 ; 56.05,14.41 55.79,14.41 C30.2 ; 16.4,11.65 C19.2 ; 16.4,11.65 16.65,11.65 17.16,12.16 ; 16.4,11.65 14.92,11.65 ; 21.14,10.97 20.67,10.5 20.67,10.42 v1(20.71,10.38) 20.71,9.83 U22.2 ; 21.14,10.97 22.66,10.97 ; 18.43,11.14 18.17,11.14 17.16,12.16 ; 18.43,11.14 C13.2 ; 18.43,11.14 18.43,11.9 19.95,13.43 20.21,13.43 20.62,13.85 ; C4.2 47.63,15.97 47.55,15.97 ; 24.94,17.83 24.96,17.85 25.1,17.85 ; 25.1,17.85 25.61,17.85 26.12,17.35 ; 25.1,17.85 19.51,23.44 16.52,23.44 15.76,22.68 15.76,21.16 C2.1 ; 22.66,10.97 22.92,10.97 23.68,11.73 23.68,12.24 ; U29.2 32.99,9.84 32.48,9.84 32.23,9.58 ; 47.55,15.97 47.55,15.72 46.28,14.45 45.43,14.45 C21.2 C5.2 46.54,10.59 46.79,10.34 46.79,9.5 U39.2 ; U12.2 14.28,14.7 v1(14.28,14.85) 14.53,15.1 14.53,15.97 U11.2 ; 20.62,13.85 C10.2 ; 20.62,13.85 21.24,14.46 21.24,15.88 U15.2 ; 32.23,9.58 32.23,9.33 31.72,8.82 31.72,7.81 32.99,6.54 35.11,6.54 36.63,8.06 36.63,8.82 ; 11.49,13.83 11.49,14.34 v1(12.25,15.1) 12.25,15.85 U10.2 ; U19.2 24.87,12.24 23.68,12.24 ; 41.59,15.34 U35.2 ; 41.59,15.34 40.06,16.86 v1(36.5,16.86) 36.38,16.86 U32.2 ; v1(14.91,9.9) U14.2
  Bottom Layer w0.254: v1(53.6,14.32) 54.11,14.83 55.38,14.83 56.05,14.15 ; v1(2.83,13.05) 3.1,13.33 8.18,13.33 10.47,15.61 10.47,16.37 ; 13.77,14.34 13.26,14.34 12.86,14.74 ; 13.77,14.34 v1(14.28,14.85) 15.04,14.09 ; 13.77,14.34 13.62,14.19 13.37,14.19 12.86,14.7 12.86,14.74 ; 10.47,16.37 v1(9.71,17.14) ; 10.47,16.37 10.98,16.37 v1(12.25,15.1) 12.5,15.1 12.86,14.74 ; v1(14.91,9.9) 14.41,9.39 13.65,9.39 13.39,9.64 13.39,10.41 15.04,12.06 15.04,14.09 ; U223.1 57.16,9.75 v1(56.6,10.31) 56.05,10.85 56.04,10.85 56.02,10.87 56.02,14.12 56.05,14.15 ; 12.86,14.74 12.86,15.72 C2.1 ; v1(34.85,18.26) 35.11,18.26 v1(36.5,16.86) ; 56.05,14.15 v1(56.31,14.41) 56.31,15.34 v1(54.53,17.12) ; 15.04,14.09 15.99,14.09 16.4,13.68 v1(16.9,13.68) 18.94,15.71 20.71,15.71 20.97,15.46 20.97,10.89 20.71,10.63 v1(20.71,10.38)
GND: length 298.3
  Top Layer w0.254: 32.73,16.01 U26.3 ; 32.73,16.01 32.99,16.27 34.51,16.27 U32.3 36.67,14.11 40.74,14.11 ; 32.73,16.01 32.73,15.76 32.23,15.25 32.23,14.49 32.61,14.11 ; 1.92,12.58 1.41,12.08 1.41,10.04 1.67,9.79 2.18,9.79 ; 1.92,12.58 C25.1 ; 1.92,12.58 1.79,12.58 1.28,13.09 1.28,13.6 1.54,13.85 3.02,13.85 ; 26.3,7.88 25.11,7.88 U20.3 24.35,8.39 23.84,7.88 22.7,7.88 ; 26.3,7.88 26.3,6.49 SW3.1 ; 26.3,7.88 C9.1 27.13,8.84 27.13,9.03 ; 25.92,10.3 25.11,10.3 U19.3 ; 25.92,10.3 26.17,10.55 26.43,10.55 26.76,10.88 26.76,11.49 25.67,12.58 ; 25.92,10.3 25.92,9.79 26.68,9.03 27.13,9.03 ; C18.1 11.31,8.78 10.42,7.88 9.49,7.88 U9.3 ; C18.1 11.06,9.54 10.55,10.05 ; C18.1 12.93,9.54 13.3,9.92 ; 9.62,18.81 10.25,19.44 10.76,19.44 11.53,18.68 11.53,17.92 ; 9.62,18.81 C22.1 ; 9.62,18.81 9.12,19.32 5.05,19.32 4.8,19.06 4.8,18.81 ; U29.3 33.5,7.63 34,7.63 34.51,8.14 34.51,8.39 ; 43.02,11.44 43.02,11.82 43.28,12.08 ; 43.02,11.44 41.37,11.44 U36.3 ; 43.02,11.44 43.02,10.68 ; 3.02,13.85 3.02,14.87 3.52,15.38 U4.3 2.77,16.39 2.77,16.78 4.29,18.3 4.8,18.3 ; 3.02,13.85 3.02,13.73 U3.3 ; 55.72,9.53 C17.1 ; 55.72,9.53 v1(55.72,8.77) ; 55.72,9.53 55.47,9.53 ; 28.65,10.3 30.5,10.3 C20.1 30.58,10.47 31.09,10.98 31.34,10.98 31.55,11.19 ; 28.65,10.3 28.65,10.04 27.64,9.03 27.13,9.03 ; 28.65,10.3 28.65,10.81 U224.2 ; 49.5,9.66 49.5,12.16 C4.1 50.14,12.72 U42.3 ; 49.5,9.66 48.99,9.66 46.45,7.12 45.69,7.12 45.43,7.38 45.43,8.39 ; 49.5,9.66 50.04,9.66 ; 11.53,17.92 12.03,17.92 12.67,17.28 12.67,16.14 U11.3 12.92,15.38 12.92,14.49 12.67,14.23 12.67,11.19 13.3,10.55 13.56,10.55 ; 11.53,17.92 11.27,17.92 10.25,16.9 10.25,16.14 10.76,15.63 ; 15.51,12.96 16.14,12.33 C24.1 ; 15.51,12.96 15.51,13.22 16.78,14.49 19.32,14.49 19.53,14.28 ; 15.51,12.96 15.26,12.71 14.57,12.71 U12.3 ; U31.3 30.49,15.46 30.49,14.11 ; 5.93,18.05 5.42,17.54 5.42,16.14 U5.3 ; 5.93,18.05 6.95,18.05 7.71,17.29 7.71,16.27 U6.3 8.35,13.85 U7.3 ; 5.93,18.05 5.05,18.05 4.8,18.3 ; 50.9,19.95 U40.3 ; 50.9,19.95 50.9,20.71 51.4,21.22 53.18,21.22 56.23,18.17 56.23,17.41 ; 50.9,19.95 50.64,19.95 49.25,18.56 49.25,18.47 ; 58.39,12.46 59.4,11.44 59.4,10.68 58.9,10.17 ; 58.39,12.46 58.13,12.71 58.01,12.71 U47.3 ; 58.39,12.46 59.15,13.22 59.15,15.89 57.63,17.41 56.23,17.41 ; U44.3 51.91,7.88 52.67,7.88 53.18,8.39 53.18,9.53 ; 4.8,18.81 4.63,18.81 C26.1 ; 4.8,18.81 4.8,18.3 ; C29.1 50.05,8.65 50.3,8.4 51.4,8.4 ; 53.18,9.53 53.18,9.79 52.16,10.81 51.91,10.81 U43.3 ; 53.18,9.53 55.47,9.53 ; U1.3 2.43,9.49 2.43,9.79 ; 34,10.68 33.24,10.68 U28.3 31.55,11.19 ; 34,10.68 34.51,10.17 34.51,8.39 ; 34,10.68 35.03,11.7 C8.1 ; 44.29,10.68 45.05,9.92 45.05,8.77 45.43,8.39 ; 44.29,10.68 44.47,10.68 C5.1 ; 44.29,10.68 43.02,10.68 ; U23.3 19.78,11.15 18.81,10.17 C13.1 18.55,9.87 ; 25.67,12.58 25.24,12.58 U18.3 ; 25.67,12.58 v1(26.17,13.09) 26.94,13.85 26.94,14.57 C12.1 ; 10.55,10.05 10.55,10.56 11.31,11.32 11.31,12.33 C23.1 ; 10.55,10.05 9.74,10.05 U8.3 ; 30.49,14.11 32.61,14.11 ; 30.49,14.11 29.48,14.11 v1(28.21,15.38) 30.71,17.88 C14.1 30.71,18.64 31.63,19.57 U25.3 ; 32.61,14.11 U27.3 ; 13.56,10.55 13.56,10.3 13.3,10.04 13.3,9.92 ; 13.56,10.55 13.81,10.55 U13.3 ; 45.43,8.39 U39.3 ; U41.3 51.91,16.27 52.42,16.27 v1(53.18,15.5) 53.69,15.5 U45.3 ; 31.55,11.19 30.58,12.16 C11.1 ; 43.02,10.68 43.02,9.92 42.51,9.41 ; 19.78,17.86 19.78,17.35 19.27,16.84 19.27,16.14 U15.3 19.53,15.38 19.53,14.28 ; 19.78,17.86 19.78,19.64 C2.2 ; 19.78,17.86 20.8,17.86 21.56,17.1 ; 55.47,9.53 55.47,11.66 C28.1 55.76,12.21 54.83,13.14 C30.1 ; 34.51,8.39 U30.3 ; C6.1 22.3,17.83 21.56,17.1 ; 42.51,9.41 42,8.9 41.5,8.9 U37.3 ; 42.51,9.41 42.51,9.15 43.28,8.39 ; C3.1 2.18,9.67 2.18,9.79 ; 13.3,9.92 13.56,9.66 13.56,8.9 U14.3 14.57,7.88 15.5,7.88 16.4,8.78 C19.1 18.22,9.54 18.55,9.87 ; U24.3 21.69,12.71 21.69,15.12 U16.3 21.56,16.27 21.56,17.1 ; 44.29,14.36 44.51,14.36 C21.1 44.55,14.49 U33.3 ; 44.29,14.36 44.29,14.61 43.28,15.63 ; 44.29,14.36 43.53,13.6 ; U2.3 2.51,9.79 2.43,9.79 ; 20.8,6.28 20.8,6.02 21.23,5.6 21.94,5.6 22.7,6.36 22.7,7.88 ; 40.74,14.11 40.99,14.11 41.5,13.6 43.53,13.6 ; 40.74,14.11 40.74,14.23 U35.3 ; 18.55,9.87 19.53,8.9 U22.3 20.29,8.39 U21.3 22.7,7.88 ; U46.3 55.72,16.14 55.72,16.9 56.23,17.41 ; 43.53,13.6 43.78,13.34 43.78,12.58 43.28,12.08 ; 2.43,9.79 2.18,9.79 ; 19.78,14.02 19.53,14.28 ; 58.9,10.17 58.01,10.17 U48.3 ; 58.9,10.17 59.66,9.41 59.66,8.9 58.64,7.88 57.88,7.88 U49.3 56.74,7.76 v1(56.48,7.76) ; 43.28,12.08 C7.1 ; v1(24.14,15.17) U17.3
  Bottom Layer w0.254: U223.2 56.48,4.96 v1(56.48,7.76) 56.48,8.01 v1(55.72,8.77) 53.94,10.55 53.94,13.09 52.93,14.11 52.93,14.61 53.18,14.87 v1(53.18,15.5) ; 24.14,15.12 v1(26.17,13.09) 28.21,15.12 v1(28.21,15.38) ; 24.14,15.12 v1(24.14,15.17) ; 24.14,15.12 17.03,22.23 C2.2
$1N22245: length 1.9
  Top Layer w0.254: U1.1 3.52,9.95 U2.4
$1N22251: length 1.9
  Top Layer w0.254: U3.4 3.52,12.37 U2.1
$1N22257: length 1.9
  Top Layer w0.254: U3.1 4.37,14.92 U4.4
$1N22263: length 5.2
  Top Layer w0.254: U4.1 4.29,17.24 v1(4.54,17.24) ; v1(6.32,14.96) 6.32,15.16 6.79,15.63
  Bottom Layer w0.254: v1(4.54,17.24) 4.54,16.73 v1(6.32,14.96)
$1N22466: length 40.3
  Top Layer w0.254: R5.2 R6.2
  Bottom Layer w0.254: R5.2 10.23,1.7 40.53,1.7 U223.7
$1N22470: length 15.3
  Top Layer w0.254: R5.1 R6.1 12.49,5.34 7.42,5.34 U1.4
$1N22510: length 21.6
  Top Layer w0.254: SW3.2 v1(33.46,4.25)
  Bottom Layer w0.254: v1(33.46,4.25) 39.38,10.17 U223.17
$1N24931: length 5.1
  Top Layer w0.254: v1(8.98,14.96) 8.98,15.42 U6.4 ; U5.1 v1(6.7,17.24)
  Bottom Layer w0.254: v1(6.7,17.24) v1(8.98,14.96)
$1N24936: length 10.9
  Top Layer w0.254: U7.4 9.33,12.71 8.56,12.71 7.59,13.69 v1(7.59,14.45) ; U6.1 v1(8.35,17.24)
  Bottom Layer w0.254: v1(7.59,14.45) 7.59,15.46 6.06,16.99 6.06,17.5 6.57,18 7.59,18 v1(8.35,17.24)
$1N24942: length 5.8
  Top Layer w0.254: U7.1 9.49,14.58 10.34,14.58 v1(10.6,14.32) ; U8.4 10.6,11.57 v1(10.6,12.04)
  Bottom Layer w0.254: v1(10.6,14.32) v1(10.6,12.04)
$1N24948: length 7.4
  Top Layer w0.254: v1(10.38,8.69) 10.13,8.69 U9.4 ; U8.1 v1(8.22,10.89)
  Bottom Layer w0.254: v1(10.38,8.69) 10.05,8.35 7.97,8.35 7.46,8.86 7.46,10.13 v1(8.22,10.89)
$1N24954: length 9.2
  Top Layer w0.254: U9.1 8.48,9.24 v1(8.22,8.99) ; U10.4 11.36,15.38 v1(11.36,15.08)
  Bottom Layer w0.254: v1(11.36,15.08) 11.53,14.92 11.53,12.04 8.48,8.99 v1(8.22,8.99)
$1N24960: length 17.8
  Top Layer w0.254: v1(11.78,17.24) 11.53,17.24 10.76,16.48 ; U11.4 13.52,15.12 v1(13.52,14.96)
  Bottom Layer w0.254: v1(13.52,14.96) 14.28,15.72 14.53,15.72 18.09,19.27 18.09,20.29 17.33,21.05 15.59,21.05 v1(11.78,17.24)
$1N24968: length 6
  Top Layer w0.254: U12.4 15.46,13.77 15.46,16.23 14.7,16.99 13.68,16.99 U11.1
$1N24974: length 13.4
  Top Layer w0.254: v1(15.55,10.42) 15.3,10.42 U13.4 ; U12.1 13.56,13.56 v1(13.56,12.54)
  Bottom Layer w0.254: v1(13.56,12.54) 12.5,11.49 12.5,9.03 13.77,7.76 15.55,7.76 16.31,8.52 16.31,9.66 v1(15.55,10.42)
$1N24980: length 6.6
  Top Layer w0.254: v1(15.5,8.72) 15.25,8.72 U14.4 ; U13.1 13.56,11.65 v1(13.3,11.4)
  Bottom Layer w0.254: v1(15.5,8.72) 13.65,8.72 12.92,9.45 12.92,11.02 v1(13.3,11.4)
$1N24986: length 9.8
  Top Layer w0.254: v1(20.34,15.08) 20.34,15.34 U15.4 ; U14.1 v1(14.06,10)
  Bottom Layer w0.254: v1(14.06,10) 19.15,15.08 v1(20.34,15.08)
$1N24992: length 5.1
  Top Layer w0.254: v1(22.83,14.96) 22.83,15.42 U16.4 ; U15.1 v1(20.54,17.24)
  Bottom Layer w0.254: v1(20.54,17.24) v1(22.83,14.96)
$1N24998: length 5.2
  Top Layer w0.254: U17.4 25.5,15.59 v1(25.5,14.96) ; v1(23.72,16.99) 22.7,16.99 U16.1
  Bottom Layer w0.254: v1(25.5,14.96) 23.72,16.73 v1(23.72,16.99)
$1N25004: length 5.4
  Top Layer w0.254: v1(26.22,14.54) 26.22,13.98 U18.4 ; v1(24.95,17.08) 24.61,16.73 U17.1
  Bottom Layer w0.254: v1(26.22,14.54) 26.22,15.81 v1(24.95,17.08)
$1N25010: length 5.1
  Top Layer w0.254: U18.1 v1(23.84,13.31) ; v1(26.13,11.27) 25.92,11.27 U19.4
  Bottom Layer w0.254: v1(26.13,11.27) 24.1,13.31 v1(23.84,13.31)
$1N25016: length 5.1
  Top Layer w0.254: U19.1 v1(23.84,10.89) ; v1(26.13,8.61) 25.67,8.61 U20.4
  Bottom Layer w0.254: v1(23.84,10.89) v1(26.13,8.61)
$1N25022: length 1.9
  Top Layer w0.254: U21.4 23.89,9.24 U20.1
$1N25030: length 1.7
  Top Layer w0.254: U22.4 20.97,9.24 U21.1
$1N25036: length 2
  Top Layer w0.254: U22.1 19.78,10.51 20.54,11.27 20.54,11.35 U23.4
$1N25042: length 4.5
  Top Layer w0.254: U23.1 20.29,12.8 21.01,12.8 21.6,12.21 21.6,11.82 21.85,11.57 22.66,11.57 U24.4
$1N25048: length 15.7
  Top Layer w0.254: U24.1 22.32,13.43 v1(22.57,13.69) ; U25.4 32.78,18.77 v1(32.48,18.77)
  Bottom Layer w0.254: v1(32.48,18.77) 27.65,13.94 27.65,13.69 26.38,12.42 25.88,12.42 24.35,13.94 22.83,13.94 v1(22.57,13.69)
$1N25054: length 5.6
  Top Layer w0.254: v1(34.35,17.54) U26.4 ; v1(31.97,20.16) 32.23,20.42 U25.1
  Bottom Layer w0.254: v1(31.97,20.16) 34.35,17.79 v1(34.35,17.54)
$1N25060: length 5.8
  Top Layer w0.254: U26.1 31.97,16.86 v1(31.97,15.85) ; U27.4 33.24,13.64 v1(33.24,13.38)
  Bottom Layer w0.254: v1(33.24,13.38) 31.97,14.65 v1(31.97,15.85)
$1N25066: length 6.2
  Top Layer w0.254: v1(33.75,15.59) 33.5,15.59 U27.1 ; U28.4 34.26,11.86 v1(34.26,12.54)
  Bottom Layer w0.254: v1(34.26,12.54) 34.26,15.08 v1(33.75,15.59)
$1N25072: length 6.1
  Top Layer w0.254: U28.1 v1(31.97,12.04) ; v1(32.23,10.51) 32.48,10.26 33.5,10.26 34.09,9.66 34.09,8.9 U29.4
  Bottom Layer w0.254: v1(32.23,10.51) 31.97,10.77 v1(31.97,12.04)
$1N25078: length 6.2
  Top Layer w0.254: U30.4 34.73,7.12 32.99,7.12 32.23,7.88 32.23,8.73 U29.1
$1N25084: length 8.2
  Top Layer w0.254: v1(31.17,14.74) U31.4 ; U30.1 v1(35.15,10.77)
  Bottom Layer w0.254: v1(31.17,14.74) 31.17,14.49 34.89,10.77 v1(35.15,10.77)
$1N25095: length 10.1
  Top Layer w0.254: v1(29.81,14.96) 29.81,15.97 U31.1 ; v1(36.58,15.63) U32.4
  Bottom Layer w0.254: v1(29.81,14.96) 31.34,16.48 35.73,16.48 v1(36.58,15.63)
$1N25101: length 14
  Top Layer w0.254: U32.1 36.16,17.5 46.45,17.5 47.05,16.9 47.05,16.14 U33.4
$1N25107: length 1.9
  Top Layer w0.254: U34.4 44.84,15.63 U33.1
$1N25113: length 2.8
  Top Layer w0.254: 43.28,16.48 42.51,15.72 42.51,15.16 U35.4
$1N25119: length 5.2
  Top Layer w0.254: U35.1 40.61,15.21 v1(40.1,14.7) ; v1(42.39,12.16) 41.93,12.16 U36.4
  Bottom Layer w0.254: v1(40.1,14.7) 40.1,14.45 v1(42.39,12.16)
$1N25125: length 5.2
  Top Layer w0.254: v1(42.43,10.26) U37.4 ; v1(40.1,12.29) 40.61,12.8 U36.1
  Bottom Layer w0.254: v1(40.1,12.29) 40.4,12.29 v1(42.43,10.26)
$1N25131: length 6
  Top Layer w0.254: U38.4 43.62,7.88 41.58,7.88 40.35,9.11 40.35,9.88 U37.1
$1N25137: length 5.1
  Top Layer w0.254: 43.28,9.24 43.28,9.5 v1(43.78,10) ; U39.4 46.07,7.92 v1(46.07,7.72)
  Bottom Layer w0.254: v1(43.78,10) v1(46.07,7.72)
$1N25143: length 12.9
  Top Layer w0.254: v1(51.53,18.72) U40.4 ; v1(46.2,10) 45.69,9.5 U39.1
  Bottom Layer w0.254: v1(51.53,18.72) 46.2,13.38 v1(46.2,10)
$1N25149: length 6.2
  Top Layer w0.254: v1(53.27,20.29) 52.76,20.8 51.91,20.8 U40.1 ; v1(53.01,17.75) 53.01,17.54 U41.4
  Bottom Layer w0.254: v1(53.01,17.75) 53.27,18 v1(53.27,20.29)
$1N25157: length 5.9
  Top Layer w0.254: v1(51.91,15.59) 51.66,15.59 50.9,16.35 50.9,17.12 U41.1 ; U42.4 52.42,13.81 v1(52.42,13.38)
  Bottom Layer w0.254: v1(51.91,15.59) 51.91,13.89 v1(52.42,13.38)
$1N25163: length 5.3
  Top Layer w0.254: v1(50.64,14.32) 51.15,14.83 U42.1 ; U43.4 52.72,11.78 v1(52.93,11.78)
  Bottom Layer w0.254: v1(50.64,14.32) 50.64,14.07 v1(52.93,11.78)
$1N25185: length 5.3
  Top Layer w0.254: U43.1 50.9,11.65 50.9,10.89 51.4,10.38 52,10.38 52.76,9.62 52.76,8.9 U44.4
$1N25190: length 9.5
  Top Layer w0.254: v1(50.64,8.99) 50.9,9.24 U44.1 ; U45.4 54.2,15.16 54.2,12.04 v1(53.18,11.02)
  Bottom Layer w0.254: v1(50.64,8.99) 51.15,8.99 v1(53.18,11.02)
$1N25196: length 7.1
  Top Layer w0.254: v1(55.21,17.5) 55.21,15.72 55.81,15.12 56.57,15.12 U46.4 ; U45.1 v1(53.31,16.99)
  Bottom Layer w0.254: v1(53.31,16.99) 54.07,17.75 54.96,17.75 v1(55.21,17.5)
$1N25202: length 5.8
  Top Layer w0.254: U46.1 56.74,16.99 57.46,16.99 58.73,15.72 58.73,13.85 U47.4
$1N27838: length 5.2
  Top Layer w0.254: v1(56.61,13.69) 57.12,14.19 U47.1 ; U48.4 58.56,11.15 v1(58.82,11.15)
  Bottom Layer w0.254: v1(58.82,11.15) 56.61,13.35 v1(56.61,13.69)
$1N27919: length 5.3
  Top Layer w0.254: U48.1 57.12,11.65 v1(56.61,11.15) ; U49.4 58.98,9.15 v1(58.98,9.2)
  Bottom Layer w0.254: v1(56.61,11.15) 57.04,11.15 v1(58.98,9.2)
$1N27977: length 42.9
  Top Layer w0.254: NOREF.1 20.97,4.25 21.55,4.82 25.61,4.82 28.15,2.28 52.78,2.28 TP1.1 55.59,5.09 55.59,7.72 57.12,9.24 U49.1

## Text on the board
Top Silkscreen Layer: V1.1
